# Altium schematic sheet Sheet6.SchDoc
size A; SheetNumber: 6; SheetTotal: 7
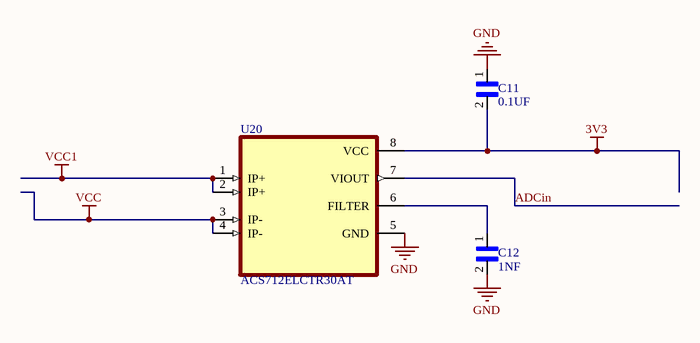
[diagram p0: Sheet6.SchDoc]

## Parts
C11  0.1UF  [CAPC2012X135N]
C12  1NF  [CAPC2012X135N]
U20  ACS712ELCTR30AT  [SOIC127P600X175-8N]

## Nets
3V3: C11.2 U20.8(VCC)
GND: C11.1 C12.2 U20.5(GND)
VCC: U20.3(IP-) U20.4(IP-)
VCC1: U20.1(IP+) U20.2(IP+)
ADCin: U20.7(VIOUT)
NetC12_1: C12.1 U20.6(FILTER)

## Library data of the parts
C11 C12 = GCM2165C2A151JA16D: Cap Ceramic 150pF 100V C0G 5% Pad SMD 0805 125Â°C Automotive T/R; Package: None; Price: None; Value: *; MP: GCM2165C2A151JA16D; Availability: Unavailable
U20 = ACS712ELCTR30AT: Current Sensor 30A 1 Channel Hall Effect, Open Loop Bidirectional 8-SOIC (0.154, 3.90mm Width); MF: Allegro MicroSystems LLC; SnapEDA_Link: https://www.snapeda.com/parts/ACS712ELCTR30AT/Allegro/view-part/?ref=snap; Package: SOIC-8 Allegro; Value: *; MP: ACS712ELCTR30AT; Check_prices: https://www.snapeda.com/parts/ACS712ELCTR30AT/Allegro/view-part/?ref=eda